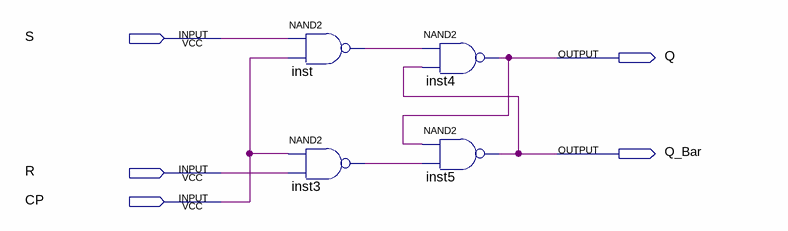
[diagram p0: schematic sheet]
// Quartus schematic SR_FF.bdf as structural Verilog: 4 symbols, 5 pins
module SR_FF (
  input  S,
  input  R,
  input  CP,
  output Q,
  output Q_Bar
);

  wire inst3_out, inst_out;

  nand inst (inst_out, S, CP);
  nand inst3 (inst3_out, CP, R);
  nand inst4 (Q, inst_out, Q_Bar);
  nand inst5 (Q_Bar, Q, inst3_out);
endmodule
